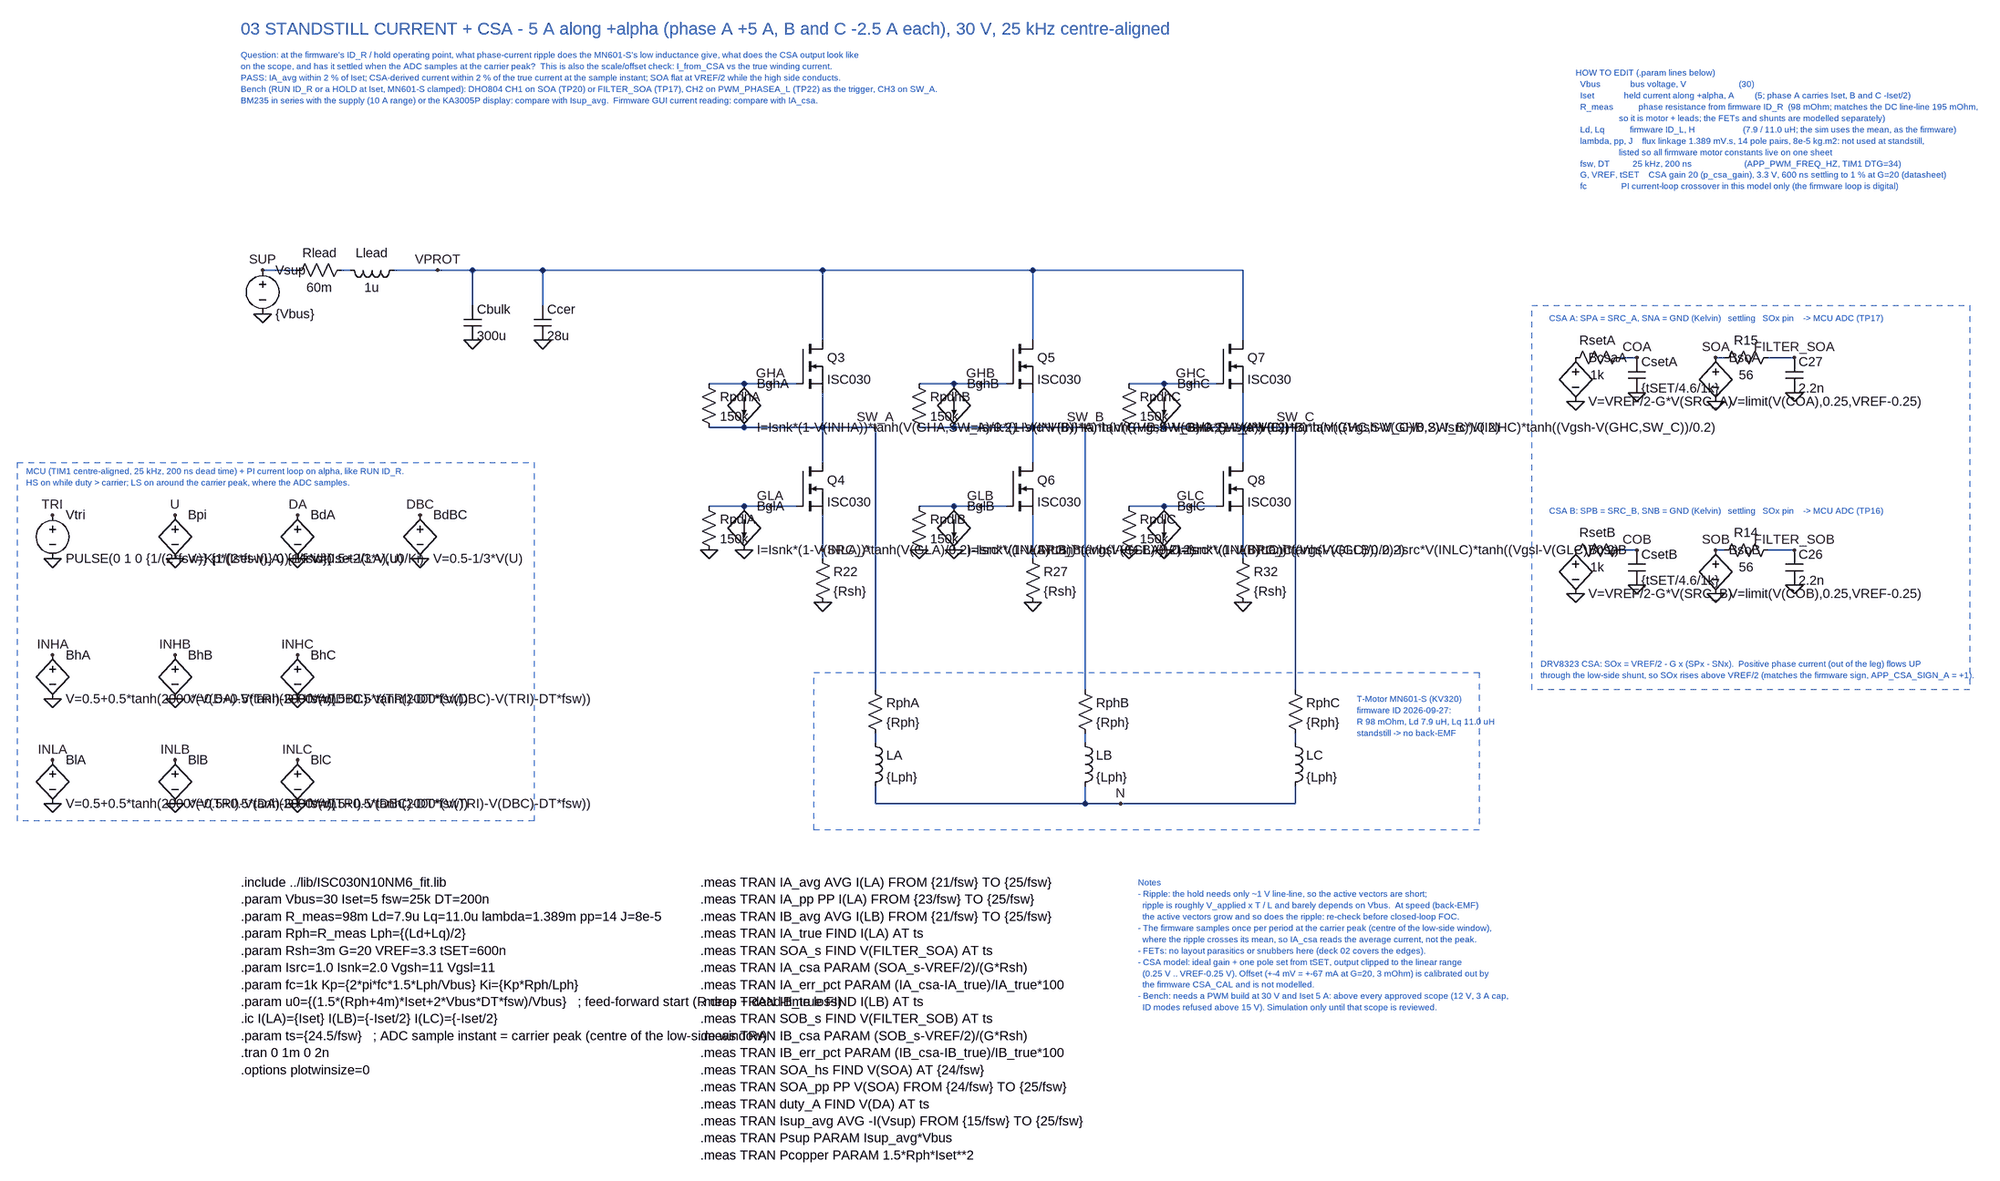
[diagram p0: schematic 03_standstill_csa.asc]
03_standstill_csa.asc, the LTspice schematic file:
Version 4
SHEET 1 3200 2200
WIRE -960 0 -896 0
WIRE -816 0 -800 0
WIRE -720 0 -640 0
WIRE -640 0 -576 0
WIRE -576 0 -448 0
WIRE -448 0 -224 0
WIRE -576 0 -576 64
WIRE -448 0 -448 64
WIRE -224 0 64 0
WIRE 64 0 448 0
WIRE 448 0 832 0
WIRE 64 0 64 128
WIRE 64 224 64 288
WIRE 64 288 64 352
WIRE 64 448 64 512
WIRE 64 512 64 528
WIRE -80 208 -32 208
WIRE -32 208 16 208
WIRE -80 288 64 288
WIRE -144 208 -80 208
WIRE -144 288 -80 288
WIRE -80 432 -32 432
WIRE -32 432 16 432
WIRE -144 432 -80 432
WIRE 64 288 160 288
WIRE 160 288 160 768
WIRE 448 0 448 128
WIRE 448 224 448 288
WIRE 448 288 448 352
WIRE 448 448 448 512
WIRE 448 512 448 528
WIRE 304 208 352 208
WIRE 352 208 400 208
WIRE 304 288 448 288
WIRE 240 208 304 208
WIRE 240 288 304 288
WIRE 304 432 352 432
WIRE 352 432 400 432
WIRE 240 432 304 432
WIRE 448 288 544 288
WIRE 544 288 544 768
WIRE 832 0 832 128
WIRE 832 224 832 288
WIRE 832 288 832 352
WIRE 832 448 832 512
WIRE 832 512 832 528
WIRE 688 208 736 208
WIRE 736 208 784 208
WIRE 688 288 832 288
WIRE 624 208 688 208
WIRE 624 288 688 288
WIRE 688 432 736 432
WIRE 736 432 784 432
WIRE 624 432 688 432
WIRE 832 288 928 288
WIRE 928 288 928 768
WIRE 160 848 160 864
WIRE 160 944 160 976
WIRE 544 848 544 864
WIRE 544 944 544 976
WIRE 928 848 928 864
WIRE 928 944 928 976
WIRE 160 976 544 976
WIRE 544 976 608 976
WIRE 608 976 928 976
WIRE 1520 160 1552 160
WIRE 1696 160 1712 160
WIRE 1792 160 1840 160
WIRE 1520 512 1552 512
WIRE 1696 512 1712 512
WIRE 1792 512 1840 512
FLAG -960 80 0
FLAG -960 0 SUP
FLAG -640 0 VPROT
FLAG -576 128 0
FLAG -448 128 0
FLAG 64 512 SRC_A
FLAG 64 608 0
FLAG -32 208 GHA
FLAG -32 432 GLA
FLAG -80 512 0
FLAG -144 512 0
FLAG 160 288 SW_A
FLAG 448 512 SRC_B
FLAG 448 608 0
FLAG 352 208 GHB
FLAG 352 432 GLB
FLAG 304 512 0
FLAG 240 512 0
FLAG 544 288 SW_B
FLAG 832 512 SRC_C
FLAG 832 608 0
FLAG 736 208 GHC
FLAG 736 432 GLC
FLAG 688 512 0
FLAG 624 512 0
FLAG 928 288 SW_C
FLAG 608 976 N
FLAG 1440 240 0
FLAG 1552 224 0
FLAG 1552 160 COA
FLAG 1696 240 0
FLAG 1696 160 SOA
FLAG 1840 224 0
FLAG 1840 160 FILTER_SOA
FLAG 1440 592 0
FLAG 1552 576 0
FLAG 1552 512 COB
FLAG 1696 592 0
FLAG 1696 512 SOB
FLAG 1840 576 0
FLAG 1840 512 FILTER_SOB
FLAG -1344 528 0
FLAG -1344 448 TRI
FLAG -1120 528 0
FLAG -1120 448 U
FLAG -896 528 0
FLAG -896 448 DA
FLAG -672 528 0
FLAG -672 448 DBC
FLAG -1344 784 0
FLAG -1344 704 INHA
FLAG -1344 976 0
FLAG -1344 896 INLA
FLAG -1120 784 0
FLAG -1120 704 INHB
FLAG -1120 976 0
FLAG -1120 896 INLB
FLAG -896 784 0
FLAG -896 704 INHC
FLAG -896 976 0
FLAG -896 896 INLC
SYMBOL voltage -960 -16 R0
SYMATTR InstName Vsup
SYMATTR Value {Vbus}
SYMBOL res -800 -16 R90
WINDOW 0 0 56 VBottom 2
WINDOW 3 32 56 VTop 2
SYMATTR InstName Rlead
SYMATTR Value 60m
SYMBOL ind -704 -16 R90
WINDOW 0 0 56 VBottom 2
WINDOW 3 32 56 VTop 2
SYMATTR InstName Llead
SYMATTR Value 1u
SYMBOL cap -592 64 R0
SYMATTR InstName Cbulk
SYMATTR Value 300u
SYMATTR SpiceLine Rser=0.1
SYMBOL cap -464 64 R0
SYMATTR InstName Ccer
SYMATTR Value 28u
SYMATTR SpiceLine Rser=2m
SYMBOL nmos 16 128 R0
SYMATTR InstName Q3
SYMATTR Value ISC030
SYMBOL nmos 16 352 R0
SYMATTR InstName Q4
SYMATTR Value ISC030
SYMBOL res 48 512 R0
SYMATTR InstName R22
SYMATTR Value {Rsh}
SYMBOL bi -80 208 R0
SYMATTR InstName BghA
SYMATTR Value I=Isnk*(1-V(INHA))*tanh(V(GHA,SW_A)/0.2)-Isrc*V(INHA)*tanh((Vgsh-V(GHA,SW_A))/0.2)
SYMBOL res -160 192 R0
SYMATTR InstName RpdhA
SYMATTR Value 150k
SYMBOL bi -80 432 R0
SYMATTR InstName BglA
SYMATTR Value I=Isnk*(1-V(INLA))*tanh(V(GLA)/0.2)-Isrc*V(INLA)*tanh((Vgsl-V(GLA))/0.2)
SYMBOL res -160 416 R0
SYMATTR InstName RpdlA
SYMATTR Value 150k
SYMBOL nmos 400 128 R0
SYMATTR InstName Q5
SYMATTR Value ISC030
SYMBOL nmos 400 352 R0
SYMATTR InstName Q6
SYMATTR Value ISC030
SYMBOL res 432 512 R0
SYMATTR InstName R27
SYMATTR Value {Rsh}
SYMBOL bi 304 208 R0
SYMATTR InstName BghB
SYMATTR Value I=Isnk*(1-V(INHB))*tanh(V(GHB,SW_B)/0.2)-Isrc*V(INHB)*tanh((Vgsh-V(GHB,SW_B))/0.2)
SYMBOL res 224 192 R0
SYMATTR InstName RpdhB
SYMATTR Value 150k
SYMBOL bi 304 432 R0
SYMATTR InstName BglB
SYMATTR Value I=Isnk*(1-V(INLB))*tanh(V(GLB)/0.2)-Isrc*V(INLB)*tanh((Vgsl-V(GLB))/0.2)
SYMBOL res 224 416 R0
SYMATTR InstName RpdlB
SYMATTR Value 150k
SYMBOL nmos 784 128 R0
SYMATTR InstName Q7
SYMATTR Value ISC030
SYMBOL nmos 784 352 R0
SYMATTR InstName Q8
SYMATTR Value ISC030
SYMBOL res 816 512 R0
SYMATTR InstName R32
SYMATTR Value {Rsh}
SYMBOL bi 688 208 R0
SYMATTR InstName BghC
SYMATTR Value I=Isnk*(1-V(INHC))*tanh(V(GHC,SW_C)/0.2)-Isrc*V(INHC)*tanh((Vgsh-V(GHC,SW_C))/0.2)
SYMBOL res 608 192 R0
SYMATTR InstName RpdhC
SYMATTR Value 150k
SYMBOL bi 688 432 R0
SYMATTR InstName BglC
SYMATTR Value I=Isnk*(1-V(INLC))*tanh(V(GLC)/0.2)-Isrc*V(INLC)*tanh((Vgsl-V(GLC))/0.2)
SYMBOL res 608 416 R0
SYMATTR InstName RpdlC
SYMATTR Value 150k
SYMBOL res 144 752 R0
SYMATTR InstName RphA
SYMATTR Value {Rph}
SYMBOL ind 144 848 R0
SYMATTR InstName LA
SYMATTR Value {Lph}
SYMBOL res 528 752 R0
SYMATTR InstName RphB
SYMATTR Value {Rph}
SYMBOL ind 528 848 R0
SYMATTR InstName LB
SYMATTR Value {Lph}
SYMBOL res 912 752 R0
SYMATTR InstName RphC
SYMATTR Value {Rph}
SYMBOL ind 912 848 R0
SYMATTR InstName LC
SYMATTR Value {Lph}
SYMBOL bv 1440 144 R0
SYMATTR InstName BcsaA
SYMATTR Value V=VREF/2-G*V(SRC_A)
SYMBOL res 1536 144 R90
WINDOW 0 0 56 VBottom 2
WINDOW 3 32 56 VTop 2
SYMATTR InstName RsetA
SYMATTR Value 1k
SYMBOL cap 1536 160 R0
SYMATTR InstName CsetA
SYMATTR Value {tSET/4.6/1k}
SYMBOL bv 1696 144 R0
SYMATTR InstName BsoA
SYMATTR Value V=limit(V(COA),0.25,VREF-0.25)
SYMBOL res 1808 144 R90
WINDOW 0 0 56 VBottom 2
WINDOW 3 32 56 VTop 2
SYMATTR InstName R15
SYMATTR Value 56
SYMBOL cap 1824 160 R0
SYMATTR InstName C27
SYMATTR Value 2.2n
SYMBOL bv 1440 496 R0
SYMATTR InstName BcsaB
SYMATTR Value V=VREF/2-G*V(SRC_B)
SYMBOL res 1536 496 R90
WINDOW 0 0 56 VBottom 2
WINDOW 3 32 56 VTop 2
SYMATTR InstName RsetB
SYMATTR Value 1k
SYMBOL cap 1536 512 R0
SYMATTR InstName CsetB
SYMATTR Value {tSET/4.6/1k}
SYMBOL bv 1696 496 R0
SYMATTR InstName BsoB
SYMATTR Value V=limit(V(COB),0.25,VREF-0.25)
SYMBOL res 1808 496 R90
WINDOW 0 0 56 VBottom 2
WINDOW 3 32 56 VTop 2
SYMATTR InstName R14
SYMATTR Value 56
SYMBOL cap 1824 512 R0
SYMATTR InstName C26
SYMATTR Value 2.2n
SYMBOL voltage -1344 432 R0
SYMATTR InstName Vtri
SYMATTR Value PULSE(0 1 0 {1/(2*fsw)} {1/(2*fsw)} 0 {1/fsw})
SYMBOL bv -1120 432 R0
SYMATTR InstName Bpi
SYMATTR Value V=Kp*(Iset-I(LA))+Ki*idt(Iset-I(LA),u0/Ki)
SYMBOL bv -896 432 R0
SYMATTR InstName BdA
SYMATTR Value V=0.5+2/3*V(U)
SYMBOL bv -672 432 R0
SYMATTR InstName BdBC
SYMATTR Value V=0.5-1/3*V(U)
SYMBOL bv -1344 688 R0
SYMATTR InstName BhA
SYMATTR Value V=0.5+0.5*tanh(2000*(V(DA)-V(TRI)-DT*fsw))
SYMBOL bv -1344 880 R0
SYMATTR InstName BlA
SYMATTR Value V=0.5+0.5*tanh(2000*(V(TRI)-V(DA)-DT*fsw))
SYMBOL bv -1120 688 R0
SYMATTR InstName BhB
SYMATTR Value V=0.5+0.5*tanh(2000*(V(DBC)-V(TRI)-DT*fsw))
SYMBOL bv -1120 880 R0
SYMATTR InstName BlB
SYMATTR Value V=0.5+0.5*tanh(2000*(V(TRI)-V(DBC)-DT*fsw))
SYMBOL bv -896 688 R0
SYMATTR InstName BhC
SYMATTR Value V=0.5+0.5*tanh(2000*(V(DBC)-V(TRI)-DT*fsw))
SYMBOL bv -896 880 R0
SYMATTR InstName BlC
SYMATTR Value V=0.5+0.5*tanh(2000*(V(TRI)-V(DBC)-DT*fsw))
RECTANGLE Normal 48 736 1264 1024 2
RECTANGLE Normal 1360 64 2160 768 2
RECTANGLE Normal -1408 352 -464 1008 2
TEXT 1040 784 Left 1 ;T-Motor MN601-S (KV320)\nfirmware ID 2026-09-27:\nR 98 mOhm, Ld 7.9 uH, Lq 11.0 uH\nstandstill -> no back-EMF
TEXT 1392 88 Left 1 ;CSA A: SPA = SRC_A, SNA = GND (Kelvin)   settling   SOx pin    -> MCU ADC (TP17)
TEXT 1392 440 Left 1 ;CSA B: SPB = SRC_B, SNB = GND (Kelvin)   settling   SOx pin    -> MCU ADC (TP16)
TEXT 1376 720 Left 1 ;DRV8323 CSA: SOx = VREF/2 - G x (SPx - SNx).  Positive phase current (out of the leg) flows UP\nthrough the low-side shunt, so SOx rises above VREF/2 (matches the firmware sign, APP_CSA_SIGN_A = +1).
TEXT -1392 368 Left 1 ;MCU (TIM1 centre-aligned, 25 kHz, 200 ns dead time) + PI current loop on alpha, like RUN ID_R.\nHS on while duty > carrier; LS on around the carrier peak, where the ADC samples.
TEXT -1000 -600 Left 3 ;03 STANDSTILL CURRENT + CSA - 5 A along +alpha (phase A +5 A, B and C -2.5 A each), 30 V, 25 kHz centre-aligned
TEXT -1000 -552 Left 1 ;Question: at the firmware's ID_R / hold operating point, what phase-current ripple does the MN601-S's low inductance give, what does the CSA output look like\non the scope, and has it settled when the ADC samples at the carrier peak?  This is also the scale/offset check: I_from_CSA vs the true winding current.\nPASS: IA_avg within 2 % of Iset; CSA-derived current within 2 % of the true current at the sample instant; SOA flat at VREF/2 while the high side conducts.\nBench (RUN ID_R or a HOLD at Iset, MN601-S clamped): DHO804 CH1 on SOA (TP20) or FILTER_SOA (TP17), CH2 on PWM_PHASEA_L (TP22) as the trigger, CH3 on SW_A.\nBM235 in series with the supply (10 A range) or the KA3005P display: compare with Isup_avg.  Firmware GUI current reading: compare with IA_csa.
TEXT 1440 -520 Left 1 ;HOW TO EDIT (.param lines below)\n  Vbus             bus voltage, V                       (30)\n  Iset             held current along +alpha, A         (5; phase A carries Iset, B and C -Iset/2)\n  R_meas           phase resistance from firmware ID_R  (98 mOhm; matches the DC line-line 195 mOhm,\n                   so it is motor + leads; the FETs and shunts are modelled separately)\n  Ld, Lq           firmware ID_L, H                     (7.9 / 11.0 uH; the sim uses the mean, as the firmware)\n  lambda, pp, J    flux linkage 1.389 mV.s, 14 pole pairs, 8e-5 kg.m2: not used at standstill,\n                   listed so all firmware motor constants live on one sheet\n  fsw, DT          25 kHz, 200 ns                       (APP_PWM_FREQ_HZ, TIM1 DTG=34)\n  G, VREF, tSET    CSA gain 20 (p_csa_gain), 3.3 V, 600 ns settling to 1 % at G=20 (datasheet)\n  fc               PI current-loop crossover in this model only (the firmware loop is digital)
TEXT -1000 1120 Left 2 !.include ../lib/ISC030N10NM6_fit.lib\n.param Vbus=30 Iset=5 fsw=25k DT=200n\n.param R_meas=98m Ld=7.9u Lq=11.0u lambda=1.389m pp=14 J=8e-5\n.param Rph=R_meas Lph={(Ld+Lq)/2}\n.param Rsh=3m G=20 VREF=3.3 tSET=600n\n.param Isrc=1.0 Isnk=2.0 Vgsh=11 Vgsl=11\n.param fc=1k Kp={2*pi*fc*1.5*Lph/Vbus} Ki={Kp*Rph/Lph}\n.param u0={(1.5*(Rph+4m)*Iset+2*Vbus*DT*fsw)/Vbus}   ; feed-forward start (R drop + dead-time loss)\n.ic I(LA)={Iset} I(LB)={-Iset/2} I(LC)={-Iset/2}\n.param ts={24.5/fsw}   ; ADC sample instant = carrier peak (centre of the low-side window)\n.tran 0 1m 0 2n\n.options plotwinsize=0
TEXT -160 1120 Left 2 !.meas TRAN IA_avg AVG I(LA) FROM {21/fsw} TO {25/fsw}\n.meas TRAN IA_pp PP I(LA) FROM {23/fsw} TO {25/fsw}\n.meas TRAN IB_avg AVG I(LB) FROM {21/fsw} TO {25/fsw}\n.meas TRAN IA_true FIND I(LA) AT ts\n.meas TRAN SOA_s FIND V(FILTER_SOA) AT ts\n.meas TRAN IA_csa PARAM (SOA_s-VREF/2)/(G*Rsh)\n.meas TRAN IA_err_pct PARAM (IA_csa-IA_true)/IA_true*100\n.meas TRAN IB_true FIND I(LB) AT ts\n.meas TRAN SOB_s FIND V(FILTER_SOB) AT ts\n.meas TRAN IB_csa PARAM (SOB_s-VREF/2)/(G*Rsh)\n.meas TRAN IB_err_pct PARAM (IB_csa-IB_true)/IB_true*100\n.meas TRAN SOA_hs FIND V(SOA) AT {24/fsw}\n.meas TRAN SOA_pp PP V(SOA) FROM {24/fsw} TO {25/fsw}\n.meas TRAN duty_A FIND V(DA) AT ts\n.meas TRAN Isup_avg AVG -I(Vsup) FROM {15/fsw} TO {25/fsw}\n.meas TRAN Psup PARAM Isup_avg*Vbus\n.meas TRAN Pcopper PARAM 1.5*Rph*Iset**2
TEXT 640 1120 Left 1 ;Notes\n- Ripple: the hold needs only ~1 V line-line, so the active vectors are short;\n  ripple is roughly V_applied x T / L and barely depends on Vbus.  At speed (back-EMF)\n  the active vectors grow and so does the ripple: re-check before closed-loop FOC.\n- The firmware samples once per period at the carrier peak (centre of the low-side window),\n  where the ripple crosses its mean, so IA_csa reads the average current, not the peak.\n- FETs: no layout parasitics or snubbers here (deck 02 covers the edges).\n- CSA model: ideal gain + one pole set from tSET, output clipped to the linear range\n  (0.25 V .. VREF-0.25 V). Offset (+-4 mV = +-67 mA at G=20, 3 mOhm) is calibrated out by\n  the firmware CSA_CAL and is not modelled.\n- Bench: needs a PWM build at 30 V and Iset 5 A: above every approved scope (12 V, 3 A cap,\n  ID modes refused above 15 V). Simulation only until that scope is reviewed.

The netlist it stands for:
* 03_standstill_csa.asc
Vsup SUP 0 {Vbus}
Rlead N001 SUP 60m
Llead VPROT N001 1u
Cbulk VPROT 0 300u Rser=0.1
Ccer VPROT 0 28u Rser=2m
M§Q3 VPROT GHA SW_A SW_A ISC030
M§Q4 SW_A GLA SRC_A SRC_A ISC030
R22 SRC_A 0 {Rsh}
BghA GHA SW_A I=Isnk*(1-V(INHA))*tanh(V(GHA,SW_A)/0.2)-Isrc*V(INHA)*tanh((Vgsh-V(GHA,SW_A))/0.2)
RpdhA GHA SW_A 150k
BglA GLA 0 I=Isnk*(1-V(INLA))*tanh(V(GLA)/0.2)-Isrc*V(INLA)*tanh((Vgsl-V(GLA))/0.2)
RpdlA GLA 0 150k
M§Q5 VPROT GHB SW_B SW_B ISC030
M§Q6 SW_B GLB SRC_B SRC_B ISC030
R27 SRC_B 0 {Rsh}
BghB GHB SW_B I=Isnk*(1-V(INHB))*tanh(V(GHB,SW_B)/0.2)-Isrc*V(INHB)*tanh((Vgsh-V(GHB,SW_B))/0.2)
RpdhB GHB SW_B 150k
BglB GLB 0 I=Isnk*(1-V(INLB))*tanh(V(GLB)/0.2)-Isrc*V(INLB)*tanh((Vgsl-V(GLB))/0.2)
RpdlB GLB 0 150k
M§Q7 VPROT GHC SW_C SW_C ISC030
M§Q8 SW_C GLC SRC_C SRC_C ISC030
R32 SRC_C 0 {Rsh}
BghC GHC SW_C I=Isnk*(1-V(INHC))*tanh(V(GHC,SW_C)/0.2)-Isrc*V(INHC)*tanh((Vgsh-V(GHC,SW_C))/0.2)
RpdhC GHC SW_C 150k
BglC GLC 0 I=Isnk*(1-V(INLC))*tanh(V(GLC)/0.2)-Isrc*V(INLC)*tanh((Vgsl-V(GLC))/0.2)
RpdlC GLC 0 150k
RphA SW_A N002 {Rph}
LA N002 N {Lph}
RphB SW_B N003 {Rph}
LB N003 N {Lph}
RphC SW_C N004 {Rph}
LC N004 N {Lph}
BcsaA P001 0 V=VREF/2-G*V(SRC_A)
RsetA COA P001 1k
CsetA COA 0 {tSET/4.6/1k}
BsoA SOA 0 V=limit(V(COA),0.25,VREF-0.25)
R15 FILTER_SOA SOA 56
C27 FILTER_SOA 0 2.2n
BcsaB P002 0 V=VREF/2-G*V(SRC_B)
RsetB COB P002 1k
CsetB COB 0 {tSET/4.6/1k}
BsoB SOB 0 V=limit(V(COB),0.25,VREF-0.25)
R14 FILTER_SOB SOB 56
C26 FILTER_SOB 0 2.2n
Vtri TRI 0 PULSE(0 1 0 {1/(2*fsw)} {1/(2*fsw)} 0 {1/fsw})
Bpi U 0 V=Kp*(Iset-I(LA))+Ki*idt(Iset-I(LA),u0/Ki)
BdA DA 0 V=0.5+2/3*V(U)
BdBC DBC 0 V=0.5-1/3*V(U)
BhA INHA 0 V=0.5+0.5*tanh(2000*(V(DA)-V(TRI)-DT*fsw))
BlA INLA 0 V=0.5+0.5*tanh(2000*(V(TRI)-V(DA)-DT*fsw))
BhB INHB 0 V=0.5+0.5*tanh(2000*(V(DBC)-V(TRI)-DT*fsw))
BlB INLB 0 V=0.5+0.5*tanh(2000*(V(TRI)-V(DBC)-DT*fsw))
BhC INHC 0 V=0.5+0.5*tanh(2000*(V(DBC)-V(TRI)-DT*fsw))
BlC INLC 0 V=0.5+0.5*tanh(2000*(V(TRI)-V(DBC)-DT*fsw))
.model NMOS NMOS
.model PMOS PMOS
.lib standard.mos
* T-Motor MN601-S (KV320)
* firmware ID 2026-09-27:
* R 98 mOhm, Ld 7.9 uH, Lq 11.0 uH
* standstill -> no back-EMF
* CSA A: SPA = SRC_A, SNA = GND (Kelvin)   settling   SOx pin    -> MCU ADC (TP17)
* CSA B: SPB = SRC_B, SNB = GND (Kelvin)   settling   SOx pin    -> MCU ADC (TP16)
* DRV8323 CSA: SOx = VREF/2 - G x (SPx - SNx).  Positive phase current (out of the leg) flows UP
* through the low-side shunt, so SOx rises above VREF/2 (matches the firmware sign, APP_CSA_SIGN_A = +1).
* MCU (TIM1 centre-aligned, 25 kHz, 200 ns dead time) + PI current loop on alpha, like RUN ID_R.
* HS on while duty > carrier; LS on around the carrier peak, where the ADC samples.
* 03 STANDSTILL CURRENT + CSA - 5 A along +alpha (phase A +5 A, B and C -2.5 A each), 30 V, 25 kHz centre-aligned
* Question: at the firmware's ID_R / hold operating point, what phase-current ripple does the MN601-S's low inductance give, what does the CSA output look like
* on the scope, and has it settled when the ADC samples at the carrier peak?  This is also the scale/offset check: I_from_CSA vs the true winding current.
* PASS: IA_avg within 2 % of Iset; CSA-derived current within 2 % of the true current at the sample instant; SOA flat at VREF/2 while the high side conducts.
* Bench (RUN ID_R or a HOLD at Iset, MN601-S clamped): DHO804 CH1 on SOA (TP20) or FILTER_SOA (TP17), CH2 on PWM_PHASEA_L (TP22) as the trigger, CH3 on SW_A.
* BM235 in series with the supply (10 A range) or the KA3005P display: compare with Isup_avg.  Firmware GUI current reading: compare with IA_csa.
* HOW TO EDIT (.param lines below)
*   Vbus             bus voltage, V                       (30)
*   Iset             held current along +alpha, A         (5; phase A carries Iset, B and C -Iset/2)
*   R_meas           phase resistance from firmware ID_R  (98 mOhm; matches the DC line-line 195 mOhm,
*                    so it is motor + leads; the FETs and shunts are modelled separately)
*   Ld, Lq           firmware ID_L, H                     (7.9 / 11.0 uH; the sim uses the mean, as the firmware)
*   lambda, pp, J    flux linkage 1.389 mV.s, 14 pole pairs, 8e-5 kg.m2: not used at standstill,
*                    listed so all firmware motor constants live on one sheet
*   fsw, DT          25 kHz, 200 ns                       (APP_PWM_FREQ_HZ, TIM1 DTG=34)
*   G, VREF, tSET    CSA gain 20 (p_csa_gain), 3.3 V, 600 ns settling to 1 % at G=20 (datasheet)
*   fc               PI current-loop crossover in this model only (the firmware loop is digital)
.include ../lib/ISC030N10NM6_fit.lib
.param Vbus=30 Iset=5 fsw=25k DT=200n
.param R_meas=98m Ld=7.9u Lq=11.0u lambda=1.389m pp=14 J=8e-5
.param Rph=R_meas Lph={(Ld+Lq)/2}
.param Rsh=3m G=20 VREF=3.3 tSET=600n
.param Isrc=1.0 Isnk=2.0 Vgsh=11 Vgsl=11
.param fc=1k Kp={2*pi*fc*1.5*Lph/Vbus} Ki={Kp*Rph/Lph}
.param u0={(1.5*(Rph+4m)*Iset+2*Vbus*DT*fsw)/Vbus}   ; feed-forward start (R drop + dead-time loss)
.ic I(LA)={Iset} I(LB)={-Iset/2} I(LC)={-Iset/2}
.param ts={24.5/fsw}   ; ADC sample instant = carrier peak (centre of the low-side window)
.tran 0 1m 0 2n
.options plotwinsize=0
.meas TRAN IA_avg AVG I(LA) FROM {21/fsw} TO {25/fsw}
.meas TRAN IA_pp PP I(LA) FROM {23/fsw} TO {25/fsw}
.meas TRAN IB_avg AVG I(LB) FROM {21/fsw} TO {25/fsw}
.meas TRAN IA_true FIND I(LA) AT ts
.meas TRAN SOA_s FIND V(FILTER_SOA) AT ts
.meas TRAN IA_csa PARAM (SOA_s-VREF/2)/(G*Rsh)
.meas TRAN IA_err_pct PARAM (IA_csa-IA_true)/IA_true*100
.meas TRAN IB_true FIND I(LB) AT ts
.meas TRAN SOB_s FIND V(FILTER_SOB) AT ts
.meas TRAN IB_csa PARAM (SOB_s-VREF/2)/(G*Rsh)
.meas TRAN IB_err_pct PARAM (IB_csa-IB_true)/IB_true*100
.meas TRAN SOA_hs FIND V(SOA) AT {24/fsw}
.meas TRAN SOA_pp PP V(SOA) FROM {24/fsw} TO {25/fsw}
.meas TRAN duty_A FIND V(DA) AT ts
.meas TRAN Isup_avg AVG -I(Vsup) FROM {15/fsw} TO {25/fsw}
.meas TRAN Psup PARAM Isup_avg*Vbus
.meas TRAN Pcopper PARAM 1.5*Rph*Iset**2
* Notes
* - Ripple: the hold needs only ~1 V line-line, so the active vectors are short;
*   ripple is roughly V_applied x T / L and barely depends on Vbus.  At speed (back-EMF)
*   the active vectors grow and so does the ripple: re-check before closed-loop FOC.
* - The firmware samples once per period at the carrier peak (centre of the low-side window),
*   where the ripple crosses its mean, so IA_csa reads the average current, not the peak.
* - FETs: no layout parasitics or snubbers here (deck 02 covers the edges).
* - CSA model: ideal gain + one pole set from tSET, output clipped to the linear range
*   (0.25 V .. VREF-0.25 V). Offset (+-4 mV = +-67 mA at G=20, 3 mOhm) is calibrated out by
*   the firmware CSA_CAL and is not modelled.
* - Bench: needs a PWM build at 30 V and Iset 5 A: above every approved scope (12 V, 3 A cap,
*   ID modes refused above 15 V). Simulation only until that scope is reviewed.
.backanno
.end